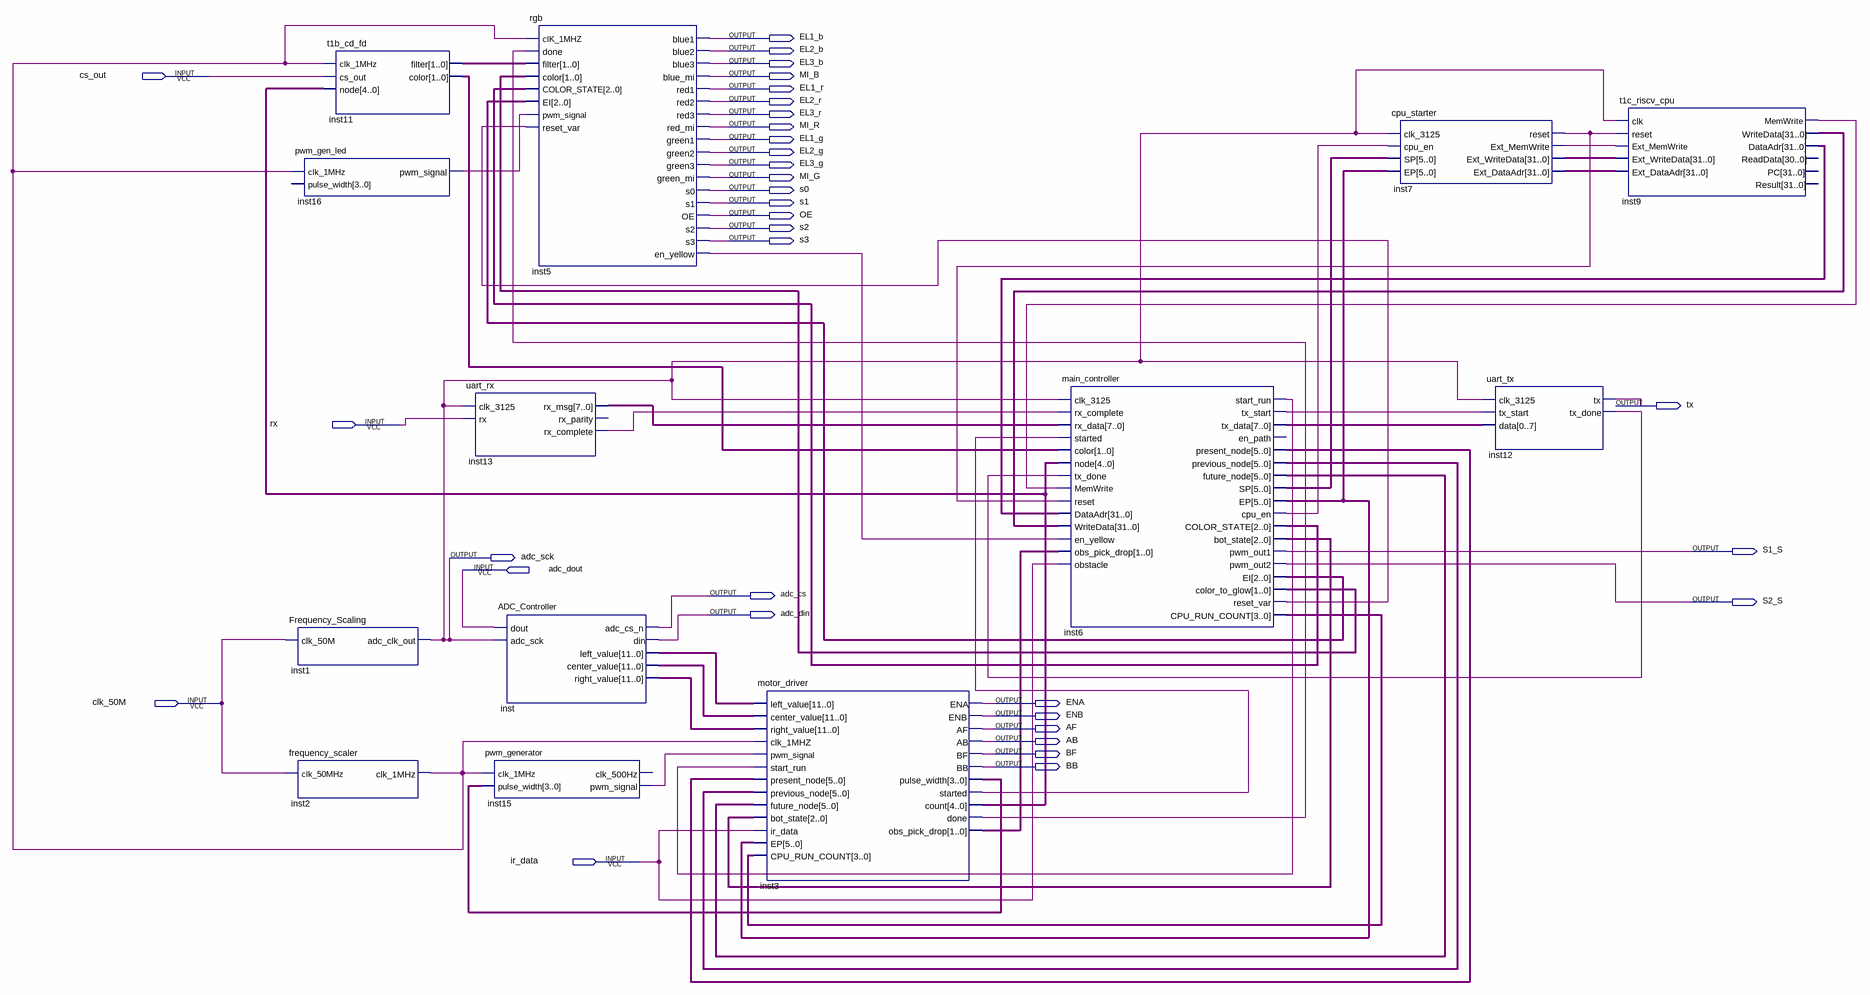
[diagram p0: schematic sheet]
// Quartus schematic LINE_FOLLOWER.bdf as structural Verilog: 13 symbols, 34 pins
module LINE_FOLLOWER (
  input  cs_out,
  input  rx,
  input  adc_dout,
  input  clk_50M,
  input  ir_data,
  output EL1_b,
  output EL2_b,
  output EL3_b,
  output MI_B,
  output EL1_r,
  output EL2_r,
  output EL3_r,
  output MI_R,
  output EL1_g,
  output EL2_g,
  output EL3_g,
  output MI_G,
  output s0,
  output s1,
  output OE,
  output s2,
  output s3,
  output tx,
  output S1_S,
  output adc_sck,
  output adc_cs,
  output S2_S,
  output adc_din,
  output ENA,
  output ENB,
  output AF,
  output AB,
  output BF,
  output BB
);

  wire inst2_clk_1mhz, inst3_done, inst3_started, inst5_en_yellow, inst6_cpu_en, inst6_reset_var,
       inst6_start_run, inst6_tx_start, inst7_ext_memwrite, inst7_reset, inst9_memwrite, inst12_tx_done,
       inst13_rx_complete, inst15_pwm_signal, inst16_pwm_signal;
  wire [1:0] inst3_obs_pick_drop, inst6_color_to_glow, inst11_color, inst11_filter;
  wire [2:0] inst6_bot_state, inst6_color_state, inst6_ei;
  wire [3:0] inst3_pulse_width, inst6_cpu_run_count;
  wire [4:0] inst3_count;
  wire [5:0] inst6_ep, inst6_future_node, inst6_present_node, inst6_previous_node, inst6_sp;
  wire [7:0] inst6_tx_data, inst13_rx_msg;
  wire [11:0] inst_center_value, inst_left_value, inst_right_value;
  wire [31:0] inst7_ext_dataadr, inst7_ext_writedata, inst9_dataadr, inst9_writedata;

  pwm_gen_led inst16 (.clk_1MHz(inst2_clk_1mhz), .pwm_signal(inst16_pwm_signal));  // open: pulse_width
  Frequency_Scaling inst1 (.clk_50M(clk_50M), .adc_clk_out(adc_sck));
  frequency_scaler inst2 (.clk_50MHz(clk_50M), .clk_1MHz(inst2_clk_1mhz));
  t1b_cd_fd inst11 (
    .clk_1MHz(inst2_clk_1mhz), .cs_out(cs_out), .node(inst3_count), .filter(inst11_filter),
    .color(inst11_color));
  uart_rx inst13 (
    .clk_3125(adc_sck), .rx(rx), .rx_msg(inst13_rx_msg), .rx_complete(inst13_rx_complete));  // open: rx_parity
  ADC_Controller inst (
    .dout(adc_dout), .adc_sck(adc_sck), .adc_cs_n(adc_cs), .din(adc_din), .left_value(inst_left_value),
    .center_value(inst_center_value), .right_value(inst_right_value));
  pwm_generator inst15 (
    .clk_1MHz(inst2_clk_1mhz), .pulse_width(inst3_pulse_width), .pwm_signal(inst15_pwm_signal));  // open: clk_500Hz
  rgb inst5 (
    .clK_1MHZ(inst2_clk_1mhz), .done(inst3_done), .filter(inst11_filter), .color(inst6_color_to_glow),
    .COLOR_STATE(inst6_color_state), .EI(inst6_ei), .pwm_signal(inst16_pwm_signal),
    .reset_var(inst6_reset_var), .blue1(EL1_b), .blue2(EL2_b), .blue3(EL3_b), .blue_mi(MI_B), .red1(EL1_r),
    .red2(EL2_r), .red3(EL3_r), .red_mi(MI_R), .green1(EL1_g), .green2(EL2_g), .green3(EL3_g),
    .green_mi(MI_G), .s0(s0), .s1(s1), .OE(OE), .s2(s2), .s3(s3), .en_yellow(inst5_en_yellow));
  motor_driver inst3 (
    .left_value(inst_left_value), .center_value(inst_center_value), .right_value(inst_right_value),
    .clk_1MHZ(inst2_clk_1mhz), .pwm_signal(inst15_pwm_signal), .start_run(inst6_start_run),
    .present_node(inst6_present_node), .previous_node(inst6_previous_node), .future_node(inst6_future_node),
    .bot_state(inst6_bot_state), .ir_data(ir_data), .EP(inst6_ep), .CPU_RUN_COUNT(inst6_cpu_run_count),
    .ENA(ENA), .ENB(ENB), .AF(AF), .AB(AB), .BF(BF), .BB(BB), .pulse_width(inst3_pulse_width),
    .started(inst3_started), .count(inst3_count), .done(inst3_done), .obs_pick_drop(inst3_obs_pick_drop));
  main_controller inst6 (
    .clk_3125(adc_sck), .rx_complete(inst13_rx_complete), .rx_data(inst13_rx_msg), .started(inst3_started),
    .color(inst11_color), .node(inst3_count), .tx_done(inst12_tx_done), .MemWrite(inst9_memwrite),
    .reset(inst7_reset), .DataAdr(inst9_dataadr), .WriteData(inst9_writedata), .en_yellow(inst5_en_yellow),
    .obs_pick_drop(inst3_obs_pick_drop), .obstacle(ir_data), .start_run(inst6_start_run),
    .tx_start(inst6_tx_start), .tx_data(inst6_tx_data), .present_node(inst6_present_node),
    .previous_node(inst6_previous_node), .future_node(inst6_future_node), .SP(inst6_sp), .EP(inst6_ep),
    .cpu_en(inst6_cpu_en), .COLOR_STATE(inst6_color_state), .bot_state(inst6_bot_state), .pwm_out1(S1_S),
    .pwm_out2(S2_S), .EI(inst6_ei), .color_to_glow(inst6_color_to_glow), .reset_var(inst6_reset_var),
    .CPU_RUN_COUNT(inst6_cpu_run_count));  // open: en_path
  cpu_starter inst7 (
    .clk_3125(adc_sck), .cpu_en(inst6_cpu_en), .SP(inst6_sp), .EP(inst6_ep), .reset(inst7_reset),
    .Ext_MemWrite(inst7_ext_memwrite), .Ext_WriteData(inst7_ext_writedata), .Ext_DataAdr(inst7_ext_dataadr));
  uart_tx inst12 (
    .clk_3125(adc_sck), .tx_start(inst6_tx_start), .data(inst6_tx_data), .tx(tx), .tx_done(inst12_tx_done));
  t1c_riscv_cpu inst9 (
    .clk(adc_sck), .reset(inst7_reset), .Ext_MemWrite(inst7_ext_memwrite),
    .Ext_WriteData(inst7_ext_writedata), .Ext_DataAdr(inst7_ext_dataadr), .MemWrite(inst9_memwrite),
    .WriteData(inst9_writedata), .DataAdr(inst9_dataadr));  // open: ReadData, PC, Result
endmodule
